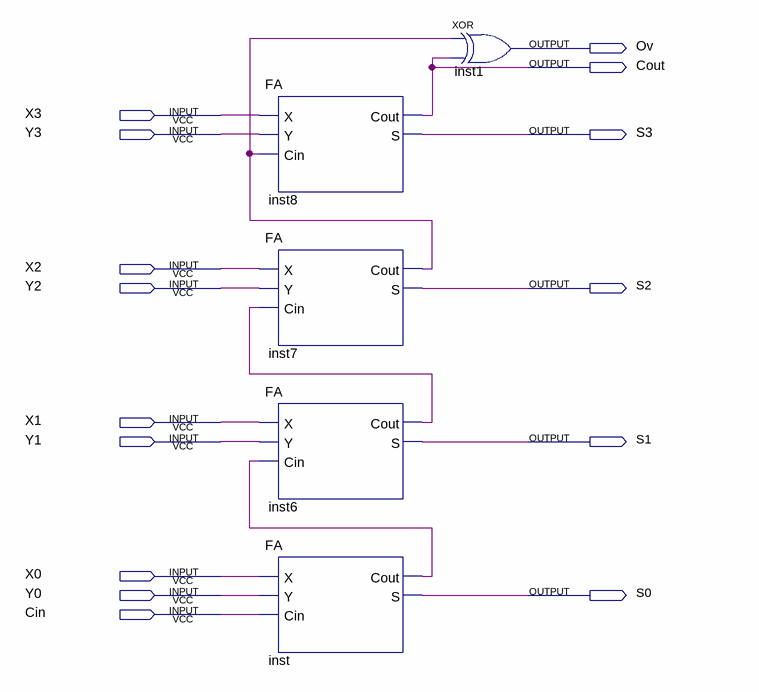
[diagram p0: schematic sheet]
// Quartus schematic adder_4bit.bdf as structural Verilog: 5 symbols, 15 pins
module adder_4bit (
  input  X3,
  input  Y3,
  input  X2,
  input  Y2,
  input  X1,
  input  Y1,
  input  X0,
  input  Y0,
  input  Cin,
  output Ov,
  output Cout,
  output S3,
  output S2,
  output S1,
  output S0
);

  wire inst6_cout, inst7_cout, inst_cout;

  FA inst8 (.X(X3), .Y(Y3), .Cin(inst7_cout), .Cout(Cout), .S(S3));
  FA inst7 (.X(X2), .Y(Y2), .Cin(inst6_cout), .Cout(inst7_cout), .S(S2));
  FA inst6 (.X(X1), .Y(Y1), .Cin(inst_cout), .Cout(inst6_cout), .S(S1));
  FA inst (.X(X0), .Y(Y0), .Cin(Cin), .Cout(inst_cout), .S(S0));
  xor inst1 (Ov, inst7_cout, Cout);
endmodule
